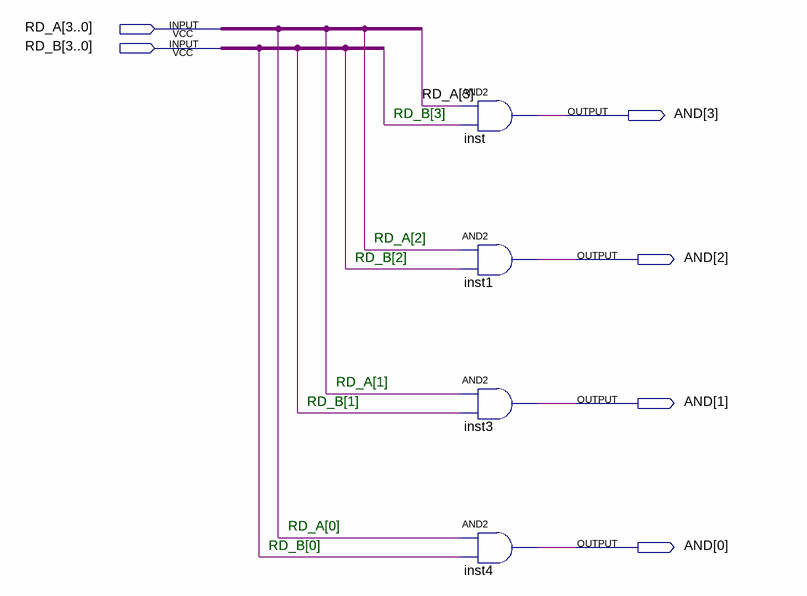
[diagram p0: schematic sheet]
// Quartus schematic AND_RD.bdf as structural Verilog: 4 symbols, 6 pins
module AND_RD (
  input  [3:0] RD_A,
  input  [3:0] RD_B,
  output [3:0] AND
);

  and inst (AND[3], RD_A[3], RD_B[3]);
  and inst1 (AND[2], RD_A[2], RD_B[2]);
  and inst3 (AND[1], RD_A[1], RD_B[1]);
  and inst4 (AND[0], RD_A[0], RD_B[0]);

  // Notes on the sheet:
  //   RD_B[3]
  //   RD_A[2]
  //   RD_B[2]
  //   RD_A[1]
  //   RD_B[1]
  //   RD_A[0]
  //   RD_B[0]
endmodule
